# EasyEDA Pro project climbsnail-spotwelder-45c7d2f7.epro, schematic 大号控制板
Create Date: 2024-03-07; Page Name: P1; Project Name: SpotWelderDev; Schematic Name: 大号控制板; Update Date: 2024-11-25; Company: 嘉立创EDA; Page Size: A4; Version: V1.0
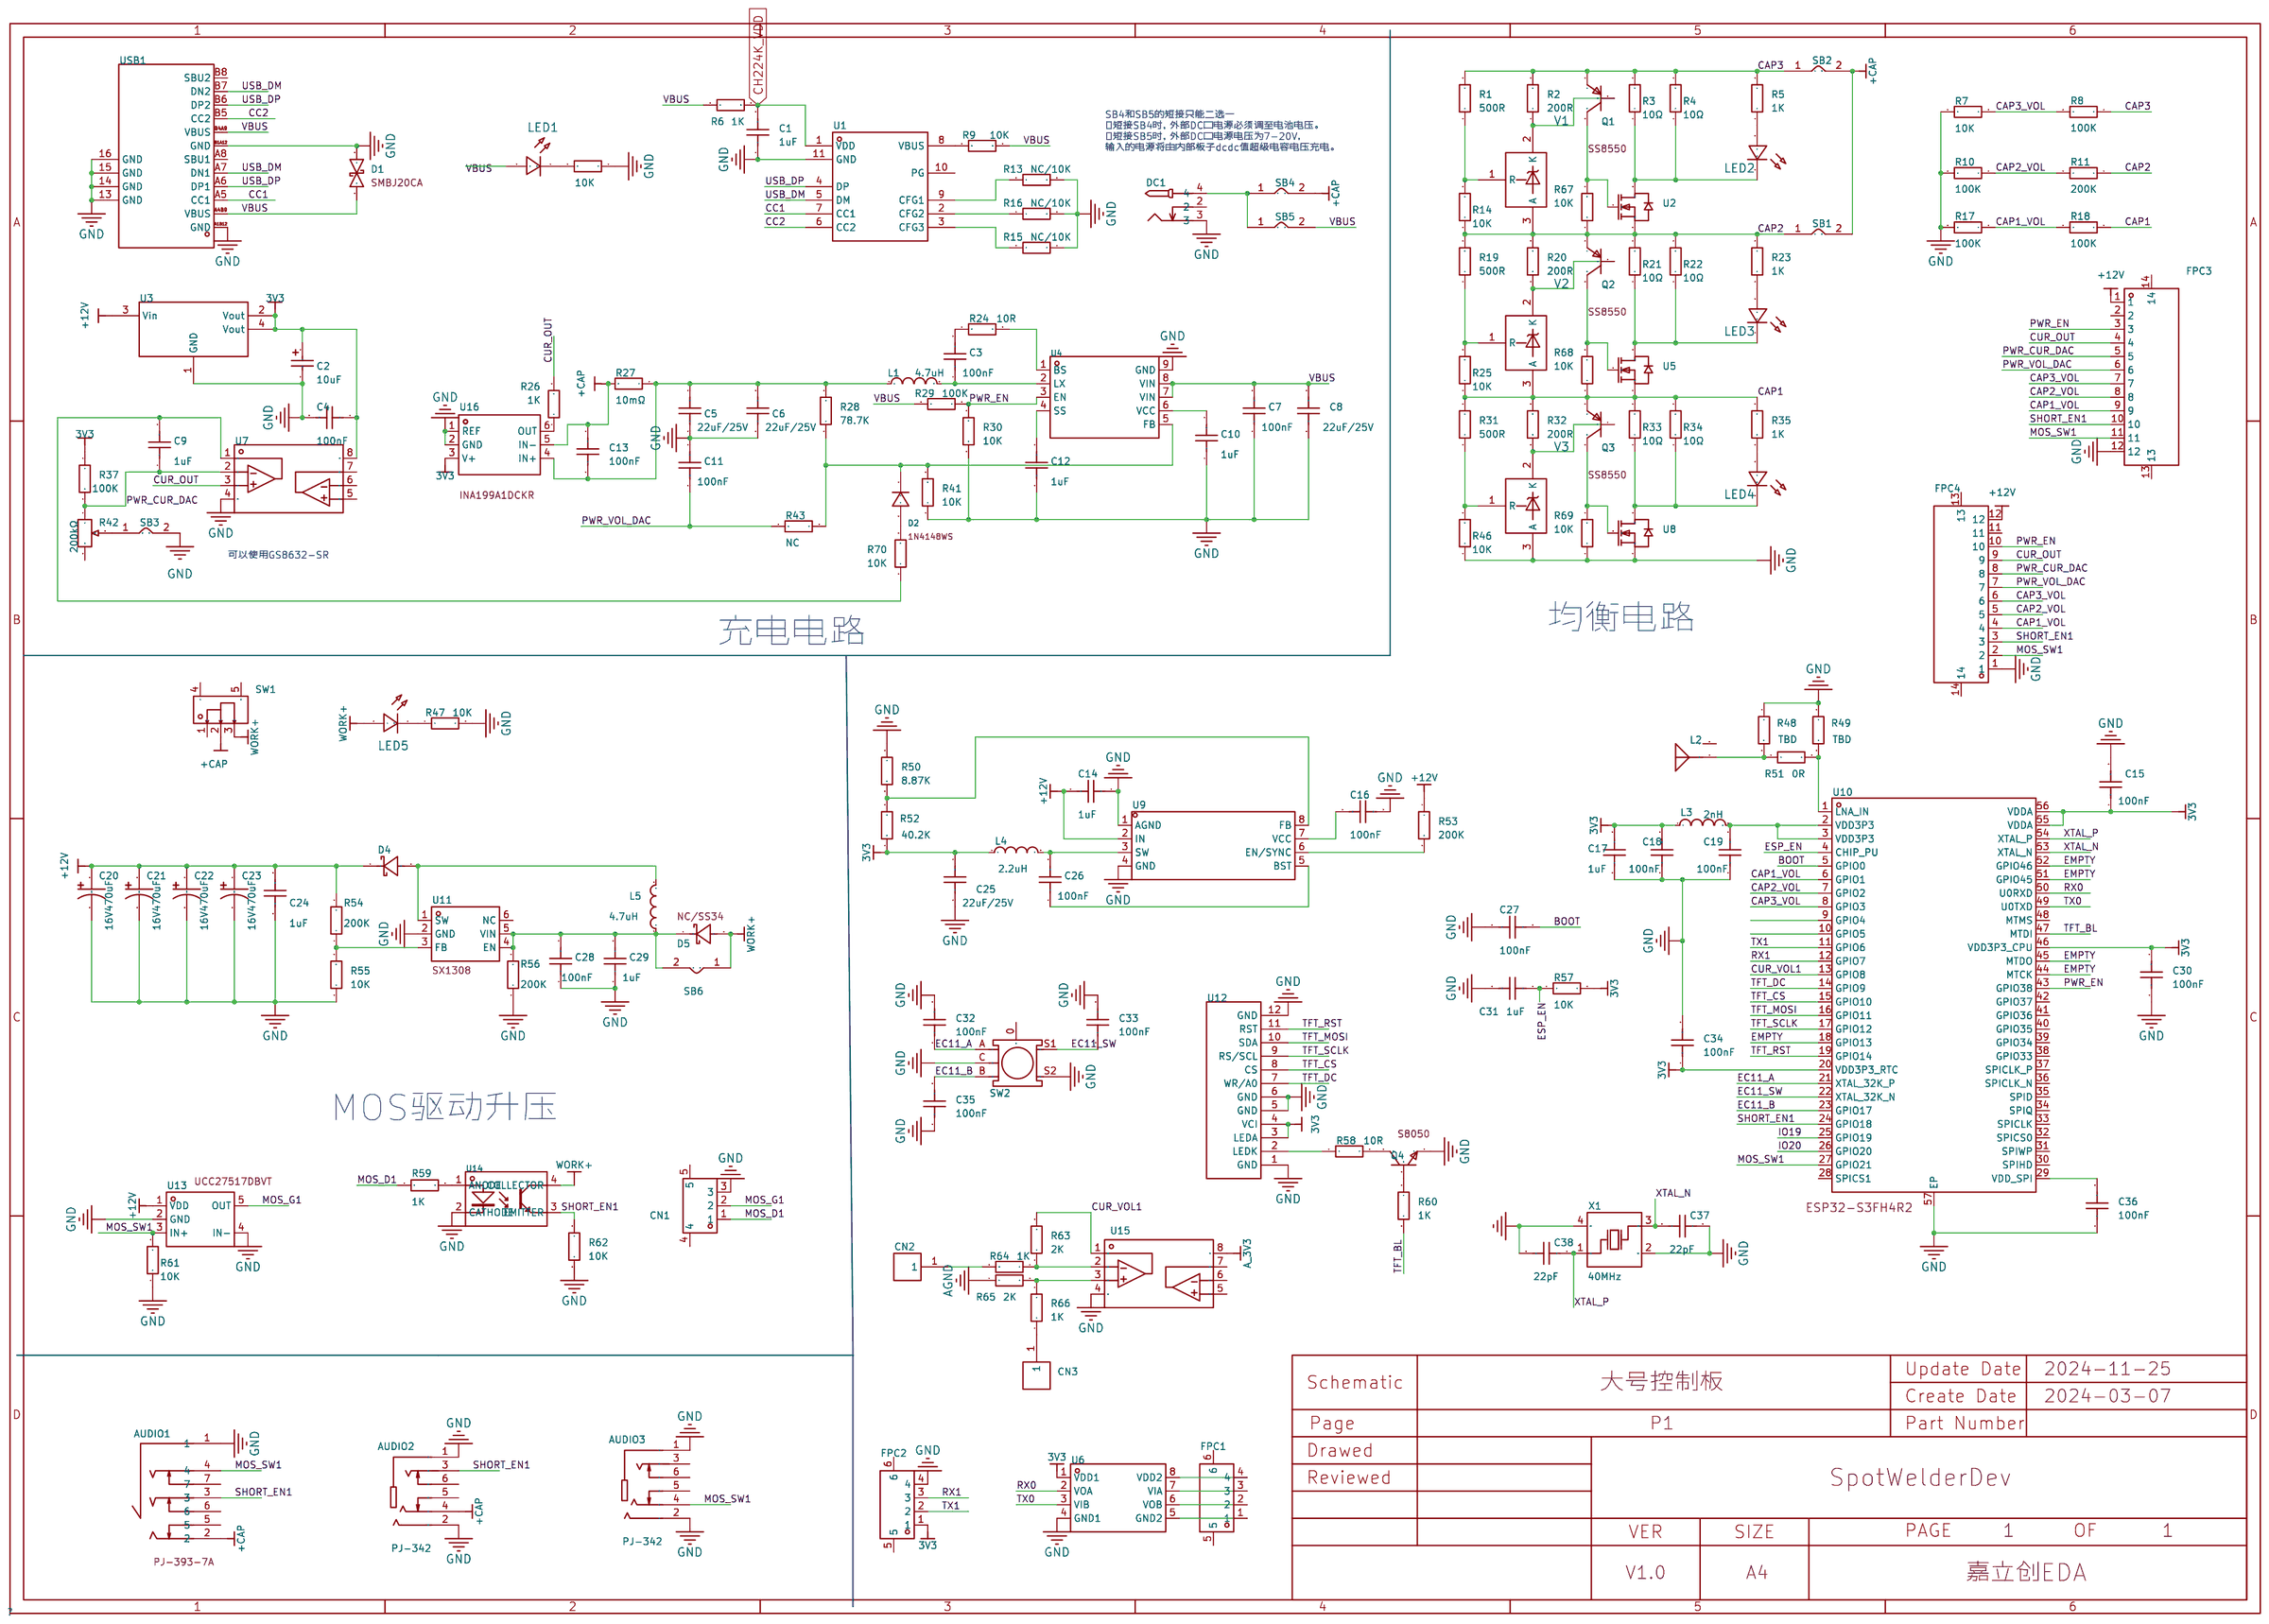
[diagram p3: schematic sheet]

## Parts
AUDIO1  PJ-393-7A  [AUDIO-SMD_PJ-393-7A]
AUDIO2  PJ-342  [AUDIO-SMD_PJ-3420-A-SMT_C319102]
AUDIO3  PJ-342  [AUDIO-SMD_PJ-3420-A-SMT_C319102]
C1  1uF  [C0603]
C2  10uF  [CAP-SMD-钽_3216]
C3  100nF  [C0402]
C4  100nF  [C0402]
C5  22uF/25V  [C1210]
C6  22uF/25V  [C1210]
C7  100nF  [C0402]
C8  22uF/25V  [C1210]
C9  1uF  [C0603]
C10  1uF  [C0603]
C11  100nF  [C0402]
C12  1uF  [C0603]
C13  100nF  [C0402]
C14  1uF  [C0603]
C15  100nF  [C0402]
C16  100nF  [C0402]
C17  1uF  [C0603]
C18  100nF  [C0402]
C19  100nF  [C0402]
C20  16V470uF  [CAP-TH_BD8.0-P3.50-D0.6-FD_1]
C21  16V470uF  [CAP-TH_BD8.0-P3.50-D0.6-FD_1]
C22  16V470uF  [CAP-TH_BD8.0-P3.50-D0.6-FD_1]
C23  16V470uF  [CAP-TH_BD8.0-P3.50-D0.6-FD_1]
C24  1uF  [C0603]
C25  22uF/25V  [C1210]
C26  100nF  [C0402]
C27  100nF  [C0402]
C28  100nF  [C0402]
C29  1uF  [C0603]
C30  100nF  [C0402]
C31  1uF  [C0603]
C32  100nF  [C0402]
C33  100nF  [C0402]
C34  100nF  [C0402]
C35  100nF  [C0402]
C36  100nF  [C0402]
C37  22pF  [C0603]
C38  22pF  [C0603]
CN1  XH2.54-3P  [CONN-SMD_3P-P2.50-WT]
CN2  5006  [TH_BD3.2-D2.0]
CN3  5006  [TH_BD3.2-D2.0]
D1  SMBJ20CA  [SMB_L4.6-W3.6-LS5.3-BI]
D2  1N4148WS  [SOD-323_L1.8-W1.3-LS2.5-RD]
D4  SS34  [SMA_L4.3-W2.6-LS5.2-RD]
D5  NC/SS34  [SMA_L4.3-W2.6-LS5.2-RD]
DC1  DC-005 2.0  [DC-IN-TH_DC-5520-1]
FPC1  X05A12H04G  [FPC-SMD_4P-P0.50_XKB_X05A12H04G]
FPC2  X05A12H04G  [FPC-SMD_4P-P0.50_XKB_X05A12H04G]
FPC3  XW05200-12  [FPC-SMD_12P-P0.50_XW05200-12]
FPC4  XW05200-12  [FPC-SMD_12P-P0.50_XW05200-12]
L1  4.7uH  [IND-SMD_L7.0-W6.6_MCW-0650-220]
L2  AN2051-245  [ANT2051]
L3  2nH  [L0402]
L4  2.2uH  [IND-SMD_L4.2-W4.2-C133189]
L5  4.7uH  [IND-SMD_L4.5-W4.0-1]
LED1  -  [LED_0603]
LED2  -  [LED_0603]
LED3  -  [LED_0603]
LED4  -  [LED_0603]
LED5  -  [LED_0603]
Q1  SS8550  [SOT-23-3_L2.9-W1.3-P1.90-LS2.4-BR]
Q2  SS8550  [SOT-23-3_L2.9-W1.3-P1.90-LS2.4-BR]
Q3  SS8550  [SOT-23-3_L2.9-W1.3-P1.90-LS2.4-BR]
Q4  S8050  [SOT-23-3_L2.9-W1.3-P1.90-LS2.4-BR]
R1  500R  [R0603]
R2  200R  [R0603]
R3  10Ω  [R2512]
R4  10Ω  [R2512]
R5  1K  [R0603]
R6  1K  [R1206]
R7  10K  [R0402]
R8  100K  [R0603]
R9  10K  [R0402]
R10  100K  [R0603]
R11  200K  [R0603]
R12  10K  [R0402]
R13  NC/10K  [R0402]
R14  10K  [R0402]
R15  NC/10K  [R0402]
R16  NC/10K  [R0402]
R17  100K  [R0603]
R18  100K  [R0603]
R19  500R  [R0603]
R20  200R  [R0603]
R21  10Ω  [R2512]
R22  10Ω  [R2512]
R23  1K  [R0603]
R24  10R  [R0603]
R25  10K  [R0402]
R26  1K  [R0603]
R27  10mΩ  [R2512]
R28  78.7K  [R0603]
R29  100K  [R0603]
R30  10K  [R0402]
R31  500R  [R0603]
R32  200R  [R0603]
R33  10Ω  [R2512]
R34  10Ω  [R2512]
R35  1K  [R0603]
R37  100K  [R0603]
R41  10K  [R0402]
R42  200kΩ  [RES-ADJ-TH_3P-L7.1-W6.9-P2.50-L_3362P]
R43  NC  [R0603]
R46  10K  [R0402]
R47  10K  [R0402]
R48  TBD  [R0402]
R49  TBD  [R0402]
R50  8.87K  [R0603]
R51  0R  [R0402]
R52  40.2K  [R0402]
R53  200K  [R0603]
R54  200K  [R0603]
R55  10K  [R0402]
R56  200K  [R0603]
R57  10K  [R0402]
R58  10R  [R0603]
R59  1K  [R0603]
R60  1K  [R0603]
R61  10K  [R0402]
R62  10K  [R0402]
R63  2K  [R0603]
R64  1K  [R0603]
R65  2K  [R0603]
R66  1K  [R0603]
R67  10K  [R0402]
R68  10K  [R0402]
R69  10K  [R0402]
R70  10K  [R0402]
SB1  短路点小型  [短路点]
SB2  短路点小型  [短路点]
SB3  短路点小型  [短路点]
SB4  短路点小型  [短路点]
SB5  短路点小型  [短路点]
SB6  短路点小型  [短路点]
SW1  SS-12D07-4  [SW-TH_3P-L8.6-W4.5-P2.60]
SW2  EC11S  [SW-TH_EC11S]
U1  -  [ESOP-10_L4.9-W3.9-P1.00-LS6.2-BL-EP]
U2  AO3400  [SOT-23-3_L2.9-W1.3-P1.90-LS2.4-BL-2]
U3  -  [SOT89L]
U4  SY8205FCC  [SOIC-8_L5.0-W4.0-P1.27-LS6.0-BL-EP2.0]
U5  AO3400  [SOT-23-3_L2.9-W1.3-P1.90-LS2.4-BL-2]
U6  π122U31  [SOIC-8_L4.9-W3.9-P1.27-LS6.0-BL]
U7  GS8632-SR / GS8332-SR  [SOP-8_L4.9-W3.9-P1.27-LS6.0-BL]
U8  AO3400  [SOT-23-3_L2.9-W1.3-P1.90-LS2.4-BL-2]
U9  -  [TSOT-23-8_L2.9-W1.6-P0.65-LS2.8-BR]
U10  ESP32-S3FH4R2  [QFN-56_L7.0-W7.0-P0.40-TL-EP4.0]
U11  SX1308  [SOT-23-6_L2.9-W1.6-P0.95-LS2.8-BR]
U12  -  [2.0TFT-FPC12P]
U13  UCC27517DBVT  [SOT-23-5_L2.9-W1.6-P0.95-LS2.8-BR]
U14  CT185GB(T1)  [SOP-4_L4.4-W3.6-P2.54-LS7.0-TL]
U15  GS8332-SR  [SOP-8_L4.9-W3.9-P1.27-LS6.0-BL]
U16  INA199A1DCKR  [SC-70-6_L2.2-W1.3-P0.65-LS2.1-BR]
USB1  TYPEC-304-BCP16  [USB-C-SMD_TYPEC-304-BCP16]
V1  -  [SOT-23-3_L2.9-W1.3-P1.90-LS2.4-BR]
V2  -  [SOT-23-3_L2.9-W1.3-P1.90-LS2.4-BR]
V3  -  [SOT-23-3_L2.9-W1.3-P1.90-LS2.4-BR]
X1  40MHz  [OSC-SMD_4P-L3.2-W2.5-BL_SIT8008BI]

## Library data of the parts
AUDIO1 = PJ-393-7A: 连接器类型:3.5mm耳机座;额定电流:500mA;额定电压:30V;; LCSC Part Name: 3.5mm耳机座; Supplier Part: C128990; Manufacturer: 韩国韩荣; Supplier Footprint: SMD; JLCPCB Part Class: Extended Part; Datasheet: https://atta.szlcsc.com/upload/public/pdf/source/20191225/C128990_2886EAE975D9B2375AA2BAB84A68AF9E.pdf; Supplier: LCSC; Connector Type: 3.5mm耳机座; Current Rating (Max): 500mA; Voltage Rating (Max): 30V
AUDIO2 AUDIO3 = PJ-3420-A-SMT: 连接器类型:3.5mm耳机座;额定电流:500mA;额定电压:30V;工作温度范围:-20℃~+70℃;焊接温度(最大值):235℃;; LCSC Part Name: 3.5mm耳机座; Supplier Part: C319102; Manufacturer: XKB Connectivity(中国星坤); Supplier Footprint: SMD; JLCPCB Part Class: 扩展库; Datasheet: https://atta.szlcsc.com/upload/public/pdf/source/20211015/FA11597DF53DC331FB6A72D64BA50234.pdf; Supplier: LCSC; Connector Type: 3.5mm耳机座; Current Rating (Max): 500mA; Voltage Rating (Max): 30V; Operating Temperature Range: -20℃~+70℃; Welding Temperature (Max): 235℃
C1 C9 C10 C12 C14 C17 C24 C29 C31 C37 C38 = CAP_0603: 容值:100nF;精度:±10%;额定电压:50V;温度系数:X7R;; Supplier Footprint: 0603
C2 = 钽电容_3216: 容值:10uF;精度:±10%;额定电压:16V;等效串联电阻:3Ω@100kHz;工作温度:-55℃~+125℃;; LCSC Part Name: 10uF ±10% 16V; Supplier Part: C7171; Manufacturer: Kyocera AVX; Manufacturer Part: TAJA106K016RNJ; Supplier Footprint: CASE-A-3216; JLCPCB Part Class: 基础库; Datasheet: https://atta.szlcsc.com/upload/public/pdf/source/20160107/1457707748093.pdf; Supplier: LCSC; Tolerance: ±10%; Rated Voltage: 16V; Equivalent Series Resistance(ESR): 3Ω@100kHz; Operating Temperature: -55℃~+125℃
C3 C4 C7 C11 C13 C15 C16 C18 C19 C26-C28 C30 C32-C36 = CAP_0402: Supplier Footprint: 0402
C5 C6 C8 C25 = CL32B226KOJNNNE: 容值:22uF;精度:±10%;额定电压:16V;材质(温度系数):X7R;; LCSC Part Name: 22uF ±10% 16V; Supplier Part: C55530; Manufacturer: SAMSUNG(三星); Supplier Footprint: 1210; JLCPCB Part Class: 扩展库; Datasheet: https://atta.szlcsc.com/upload/public/pdf/source/20191106/C444885_D1DE823F0ED498E02883F0194C396E9C.pdf; Supplier: LCSC; Tolerance: ±10%; Voltage Rated: 16V; Temperature Coefficient: X7R
C20-C23 = SM4771AME072RB: 容值:470uF;精度:±20%;额定电压:10V;纹波电流:-;等效串联电阻:-;; LCSC Part Name: 470uF ±20% 10V; Supplier Part: C399139; Manufacturer: Xunda(讯达); Supplier Footprint: 插件,D8xL7mm; JLCPCB Part Class: 扩展库; Datasheet: https://atta.szlcsc.com/upload/public/pdf/source/20190625/C399172_C16A14E74FCFCF01C711FA10034874FD.pdf; Supplier: LCSC; Tolerance: ±20%; Rated Voltage: 10V; φD: 8mm; L: 7mm; Lead Spacing: 3.5mm; Lifetime @ Temp: 1000hrs@105℃
CN1 = XH2.54-3P: Supplier Part: C9900004346; Supplier Footprint: XH2.54-3PSMD; JLCPCB Part Class: 扩展库; Supplier: LCSC
CN2 CN3 = 5006_C2906764: 测试点; Supplier Part: C2906764; Manufacturer: Keystone; JLCPCB Part Class: 扩展库; Datasheet: https://atta.szlcsc.com/upload/public/pdf/source/20211115/64B944F8418AA2CF0680BB1B201435FB.pdf; Supplier: LCSC
D1 = SMBJ20CA_C330066: 极性:Bidirectional;峰值脉冲电流（10/1000us）:18.6A;箝位电压:32.4V;击穿电压（最小值）:22.2V;反向关断电压（典型值）:20V;; Supplier Part: C330066; Manufacturer: JJW(捷捷微); Supplier Footprint: SMB; JLCPCB Part Class: 扩展库; Datasheet: https://atta.szlcsc.com/upload/public/pdf/source/20181120/C330066_68D95E2092C63B883987103083FFA20D.pdf; Supplier: LCSC
D2 = 1N4148WS_C2128: 二极管配置:独立式;功率:200mW;直流反向耐压(Vr):100V;平均整流电流(Io):150mA;正向压降(Vf):1.25V@150mA;反向电流(Ir):1uA@75V;反向恢复时间(trr):4ns;工作温度:+150℃@(Tj);; LCSC Part Name: 100V 150mA 4ns T4; Supplier Part: C2128; Manufacturer: CJ(江苏长电/长晶); Supplier Footprint: SOD-323; JLCPCB Part Class: 基础库; Datasheet: https://atta.szlcsc.com/upload/public/pdf/source/20140809/1457707208178.pdf; Supplier: LCSC; Diode Configuration: 独立式; Power Dissipation: 200mW; Reverse Voltage (Vr): 100V; Average Rectified Current (Io): 150mA; Forward Voltage (Vf@If): 1.25V@150mA; Reverse Leakage Current: 1uA@75V; Reverse Recovery Time (trr): 4ns; Operating Temperature: +150℃@(Tj)
D4 = SS34_C3032484: Supplier Part: C3032484; Manufacturer: TDD(台冠电子); Supplier Footprint: SMA; JLCPCB Part Class: Extended Part; Datasheet: https://atta.szlcsc.com/upload/public/pdf/source/20220622/9D70D0693761B542BF6F533590093AA5.pdf; Supplier: LCSC
D5 = SS34_C3032484: LCSC Part Name: SS34; Supplier Part: C3032484; Manufacturer: TDD(台冠电子); Supplier Footprint: SMA; JLCPCB Part Class: Extended Part; Datasheet: https://atta.szlcsc.com/upload/public/pdf/source/20220622/9D70D0693761B542BF6F533590093AA5.pdf; Supplier: LCSC
DC1 = DC-005 2.0: 连接器类型:DC电源插座;安装方式:弯插;触点内径:2mm;触点外径:6.4mm;额定电流:-;额定电压:-;工作温度范围:-;; LCSC Part Name: DC电源插座 内径:2mm 外径:6.4mm 铁材质; Supplier Part: C16214; Manufacturer: BOOMELE(博穆精密); Supplier Footprint: 插件; JLCPCB Part Class: 扩展库; Datasheet: https://atta.szlcsc.com/upload/public/pdf/source/20190827/C16214_DA59F99E888FED58D9833F5341D610B0.pdf; Supplier: LCSC; Connector Type: DC电源插座; Mounting Style: 弯插; Inside Contact Diameter: 2mm; Outside Contact Diameter: 6.4mm
FPC1 FPC2 = X05A12H04G: 间距:0.5mm;触点数量:4;锁定特性:翻盖式;安装类型:卧贴;触点类型:双侧触点/上下接;工作温度范围:-40℃~+85℃;焊接温度(最大值):260℃;; LCSC Part Name: 0.5mm P数:4 翻盖式 双侧触点/上下接; Supplier Part: C2880761; Manufacturer: XKB Connectivity(中国星坤); Supplier Footprint: SMD,P=0.5mm; Datasheet: https://atta.szlcsc.com/upload/public/pdf/source/20211011/7594ED4A8B21B39D6C2C07571E80F84E.pdf; Supplier: LCSC; Pitch: 0.5mm; Number of Contacts: 4; Locking Feature: 翻盖式; Mounting Type: 卧贴; Contact Type: 双侧触点/上下接; Height Above Board: 1.2mm; FFC, FCB Thickness: 0.3mm; Contact Material: 磷青铜; Contact Plating: 金; Operating Temperature Range: -40℃~+85℃; Welding Temperature (Max): 260℃
FPC3 FPC4 = XW05200-12: 锁定特性:翻盖式;触点类型:下接;触点数量:12P;间距:0.5mm;安装类型:卧贴;; LCSC Part Name: 间距:0.5mm P数:12P 翻盖式 下接; Supplier Part: C376060; Manufacturer: MINTRON(明硕); Supplier Footprint: SMD,P=0.5mm,卧贴; JLCPCB Part Class: 扩展库; Datasheet: https://atta.szlcsc.com/upload/public/pdf/source/20190925/C432224_CE7A48F01954EF0C4D4C1EC1B5A1C250.pdf; Supplier: LCSC; Locking Feature: 翻盖式; Contact Type: 下接; Number of Contacts: 12P; Pitch: 0.5mm; Mounting Type: 卧贴; FFC, FCB Thickness: 0.3mm; Height Above Board: 2mm
L1 = MCW-0650-220-N2: 电感值:22uH;精度:±20%;额定电流:2.6A;直流电阻(DCR):140mΩ;; LCSC Part Name: 22uH ±20% 2.6A 140mΩ; Supplier Part: C177257; Manufacturer: Hk-hotline(合泰盟方); Supplier Footprint: SMD,6.95x6.6x5mm; JLCPCB Part Class: 扩展库; Datasheet: https://atta.szlcsc.com/upload/public/pdf/source/20180126/C177257_15169518534351308687.pdf; Supplier: LCSC; Tolerance: ±20%; Rated Current: 2.6A; DC Resistance (DCR): 140mΩ
L2 = AN2051-245: 小体积，高增益，WIFI，蓝牙，zigBee 2.4G天线; Supplier Part: C99727; Manufacturer: rainsun(霖昱微); Supplier Footprint: 2051; JLCPCB Part Class: 扩展库; Datasheet: https://atta.szlcsc.com/upload/public/pdf/source/20170329/1490752053541.pdf; Supplier: LCSC
L3 = LQG15HS2N0S02D: 电感值:2nH;精度:±0.3nH;额定电流:900mA;饱和电流(Isat):-;直流电阻(DCR):90mΩ;; LCSC Part Name: 2nH ±0.3nH 90mΩ; Supplier Part: C18216; Manufacturer: muRata(村田); Supplier Footprint: 0402; JLCPCB Part Class: 扩展库; Datasheet: https://atta.szlcsc.com/upload/public/pdf/source/20190514/C18216_4C6D770518CF7A3B206943E09D2940CE.pdf; Supplier: LCSC; Tolerance: ±0.3nH; Rated Current: 900mA; DC Resistance (DCR): 90mΩ; Q @ Freq: 8@100MHz; Frequency - Self Resonant: 6GHz
L4 = HA42-2R2MT: 电感值:2.2uH;精度:±20%;额定电流:3A;饱和电流(Isat):5A;直流电阻(DCR):58mΩ;; LCSC Part Name: 2.2uH ±20% 3A 58mΩ; Supplier Part: C2936650; Manufacturer: FH(风华); Supplier Footprint: 0420; JLCPCB Part Class: 扩展库; Datasheet: https://atta.szlcsc.com/upload/public/pdf/source/20211228/DF5AAD1C624D1DACD739A51BD94418BC.pdf; Supplier: LCSC; Tolerance: ±20%; Rated Current: 3A; Saturation Current (Isat): 5A; DC Resistance (DCR): 58mΩ
L5 = MCS0420-4R7MPN2: 电感值:4.7uH;精度:±20%;额定电流:2.2A;饱和电流(Isat):3.5A;直流电阻(DCR):98mΩ;; LCSC Part Name: 4.7uH ±20% 2.2A 98mΩ; Supplier Part: C2937092; Manufacturer: PSA(信昌电陶); Supplier Footprint: 0420; JLCPCB Part Class: Extended Part; Datasheet: https://atta.szlcsc.com/upload/public/pdf/source/20220121/BD01ABADD177E465ADC6F87339B1CE90.pdf; Supplier: LCSC; Tolerance: ±20%; Rated Current: 2.2A; Saturation Current (Isat): 3.5A; DC Resistance (DCR): 98mΩ
LED1-LED5 = LED_0603-R: Supplier Footprint: 0603
Q1-Q3 = SS8550 Y2_C8542: 晶体管类型:PNP;集射极击穿电压(Vceo):25V;集电极电流(Ic):1.5A;功率(Pd):300mW;集电极截止电流(Icbo):100nA;集电极-发射极饱和电压(VCE(sat)@Ic,Ib):500mV@800mA,80mA;直流电流增益(hFE@Ic,Vce):200@100mA,1V;特征频率(fT):100MHz;工作温度:+150℃@(Tj);; LCSC Part Name: PNP 25V 1.5A; Supplier Part: C8542; Manufacturer: CJ(江苏长电/长晶); Supplier Footprint: SOT-23; JLCPCB Part Class: 基础库; Datasheet: https://atta.szlcsc.com/upload/public/pdf/source/20140809/1457707214734.pdf; Supplier: LCSC; Transistor Type: PNP; Collector-Emitter Breakdown Voltage (Vceo): 25V; Collector Current (Ic): 1.5A; Power Dissipation (Pd): 300mW; Collector Cut-Off Current (Icbo): 100nA; Collector-Emitter Saturation Voltage (VCE(sat)@Ic,Ib): 500mV@800mA,80mA; DC Current Gain (hFE@Ic,Vce): 200@100mA,1V; Transition Frequency (fT): 100MHz; Operating Temperature: +150℃@(Tj)
Q4 = S8050_C2891804: Supplier Part: C2891804; Manufacturer: YONGYUTAI(永裕泰); Supplier Footprint: SOT-23; JLCPCB Part Class: 扩展库; Datasheet: https://atta.szlcsc.com/upload/public/pdf/source/20210901/5347316A10609C628D4D69AE01446E5B.pdf; Supplier: LCSC
R1 R2 R5 R8 R10 R11 R17-R20 R23 R24 R26 R28 R29 R31 R32 R35 R37 R43 R50 R53 R54 R56 R58-R60 R63-R66 = Res_0603: Supplier Footprint: 0603
R3 R4 R21 R22 R33 R34 = RC-12L3R3JT: 阻值:3.3Ω;精度:±5%;功率:1W;; LCSC Part Name: 3.3Ω ±5% 1W; Supplier Part: C341653; Manufacturer: FH(风华); Supplier Footprint: 2512; JLCPCB Part Class: 扩展库; Datasheet: https://atta.szlcsc.com/upload/public/pdf/source/20181129/C341653_9079355966F8762BA30788198634DD3F.pdf; Supplier: LCSC; Tolerance: ±5%; Power(Watts): 1W; Temperature Coefficient: ±250ppm/℃
R6 = Res_1206: Supplier Footprint: 1206
R7 R9 R12-R16 R25 R30 R41 R46-R49 R51 R52 R55 R57 R61 R62 R67-R70 = Res_0402: Supplier Footprint: 0402
R27 = FMF25FPJR010-LH_C105366: 阻值:10mΩ;精度:±1%;功率:2W;; Power(Watts): 2W; Supplier: LCSC; Supplier Part: C105366; Supplier Footprint: 2512; JLCPCB Part Class: 扩展库; LCSC Part Name: 10mΩ ±1% 2W; Tolerance: ±1%; Datasheet: https://atta.szlcsc.com/upload/public/pdf/source/20170410/1491788445504.pdf; Manufacturer: PSA(信昌电陶); Manufacturer Part: FMF25FPJR010-LH; Temperature Coefficient: ±70ppm/℃
R42 = 3362P-1-204: 阻值:200kΩ;精度:±10%;; LCSC Part Name: 200kΩ ±10%; Supplier Part: C118941; Manufacturer: BOCHEN(博晨); Supplier Footprint: 插件; JLCPCB Part Class: Extended Part; Datasheet: https://atta.szlcsc.com/upload/public/pdf/source/20171114/C118941_15106326619261117430.pdf; Supplier: LCSC; Tolerance: ±10%
SB1-SB6 = 短路点小型
SW1 = SS-12D07-4: 安装方式:直插;机械寿命:10000;滑钮形状:矩形柱状;引脚样式:PC引脚;工作温度:-10~+60;开关长度:8.6mm;开关宽度:4.5mm;开关高度:8.7mm;; Supplier Part: C2857672; Manufacturer: ROCPU Switches(台普); Supplier Footprint: 插件; JLCPCB Part Class: Extended Part; Datasheet: https://atta.szlcsc.com/upload/public/pdf/source/20211210/33917120591D6789761CF4E765778736.pdf; Supplier: LCSC; Mounting Style: 直插; Mechanical Life: 10000; Actuator Style: 矩形柱状; Pin Style: PC引脚; Operating Temperature: -10~+60; Switch Length: 8.6mm; Switch Width: 4.5mm; Switch Height: 8.7mm
SW2 = EC11S: Supplier Part: C2895684; Supplier Footprint: Though hole; JLCPCB Part Class: 扩展库; Datasheet: 2021-09-09/817225A/75f6073b840d48199edf7d0159dcd6be/EC11S-H6-5B2-20K10-20P.pdf; Supplier: LCSC
U1 = CH224K: 类型:-;协议类别:-;驱动器/接收器数:-;数据速率:-;; Supplier Part: C970725; Manufacturer: WCH(南京沁恒); Supplier Footprint: ESSOP-10; JLCPCB Part Class: Extended Part; Datasheet: https://atta.szlcsc.com/upload/public/pdf/source/20220425/5F3B4646B9AC793D88468BCB08421765.pdf; Supplier: LCSC
U2 U5 U8 = AO3400: Supplier Part: C9900013365; Supplier Footprint: SOT-23; JLCPCB Part Class: 扩展库; Datasheet: 2022-04-08/830516A/bc9ad5c09bcf47d2b260b07161827fa1/AO3400A.PDF; Supplier: LCSC
U3 = CJ1117-XXX-SOT89L: 锡膏贴片
U4 = SY8205FCC: 功能类型:降压型;同步整流:-;输出通道数:-;拓扑结构:-;输入电压:-;输出电流(最大值):-;开关频率:-;; LCSC Part Name: 降压型; Supplier Part: C111875; Manufacturer: silergy(矽力杰); Supplier Footprint: SOIC-8-EP; JLCPCB Part Class: 扩展库; Datasheet: https://atta.szlcsc.com/upload/public/pdf/source/20180224/C111875_15194360670851363275.pdf; Supplier: LCSC; Function: 降压型
U6 = π122U31: 应用:-;隔离技术:-;通道数:2;隔离电压(Viso):3000Vrms;; LCSC Part Name: 增强型ESD,3.0kVrms/6.0kVrms 150Kbps双通道数字隔离器; Supplier Part: C471590; Manufacturer: 2Pai Semi(荣湃); Supplier Footprint: SOIC-8; JLCPCB Part Class: 扩展库; Datasheet: https://atta.szlcsc.com/upload/public/pdf/source/20191223/C471590_0EC0A3D8C50EA147F11BC2F4781C203C.pdf; Supplier: LCSC; Number of Channels: 2; Forward Channel: 0; Reverse channel: 2; Voltage Isolation or Not: 带电压隔离; Isolation voltage: 3000Vrms; Data Rate: 150Kbps; Supply Voltage: 3V~5.5V
U7 U15 = GS8332-SR: 运放类型:Zero-Drift;放大器组数:2;增益带宽积（GBP）:350KHz;压摆率（SR）:0.2 V/us;电源电压:2.1V ~ 5.5V;各通道供电电流:20uA;; LCSC Part Name: GS8332 SOP-8; Supplier Part: C157713; Manufacturer: Gainsil(聚洵); Supplier Footprint: SOP-8-150mil; JLCPCB Part Class: 扩展库; Datasheet: https://atta.szlcsc.com/upload/public/pdf/source/20200615/C605419_D70E1851DA800D34ADA08E397521FED7.pdf; Supplier: LCSC; Amplifier Type: Zero-Drift; Number of Circuits: 2; Gain Bandwidth Product（GBP）: 350KHz; Slew Rate（SR）: 0.2 V/us; Output Type: Rail-to-Rail; Supply Voltage（Single）: 2.1V ~ 5.5V; Iq per channel (Typ): 20uA; Operating Temperature: -40°C ~ 125°C
U9 = MP2225GJ-Z: 最大输入电压:-;可输出电流:-;; Supplier Part: C133066; Supplier Footprint: TSOT-23-8; JLCPCB Part Class: 扩展库; Supplier: LCSC
U10 = ESP32-S3: Supplier Part: C2913192; Manufacturer: ESPRESSIF(乐鑫); Supplier Footprint: QFN-56-EP(7x7); JLCPCB Part Class: 扩展库; Datasheet: https://atta.szlcsc.com/upload/public/pdf/source/20220211/8CA5C1C53CA8E3D1871752073201D38A.pdf; Supplier: LCSC
U11 = SX1308: 功能类型:升压型;同步整流:否;输出通道数:1;拓扑结构:升压式;输入电压:2V~24V;输出电压:28V;输出电流(最大值):-;开关频率:1.2MHz;; LCSC Part Name: 升压型 Vin=2V~24V Vout=28V; Supplier Part: C78162; Manufacturer: SX(硕芯科技); Supplier Footprint: SOT-23-6; JLCPCB Part Class: Extended Part; Datasheet: https://atta.szlcsc.com/upload/public/pdf/source/20160920/1474356679185.pdf; Supplier: LCSC; Function: 升压型; Synchronous Rectification: 否; Number of Outputs: 1; Topology: 升压式; Input Voltage: 2V~24V; Output Voltage: 28V; Switching Frequency: 1.2MHz
U12 = 2.0TFT-FPC12P-ST7789
U13 = UCC27517DBVT: 采用 SOT-23 封装、具有 5V UVLO 和 13ns 传播延迟的 4A/4A 单通道栅极驱动器 5-SOT-23 -40 to 140; Supplier Part: C2877770; Manufacturer: TI(德州仪器); Supplier Footprint: SOT-23-5; JLCPCB Part Class: Extended Part; Supplier: LCSC
U14 = CT185GB(T1): 输入电压类型:DC;输出通道数:1;正向电压:1.24V;反向电压:6V;输出电流:50mA;接收端电压:80V;集射极饱和电压(Vce(sat)@Ic,IF):300mV@2.4mA,8mA;隔离电压(rms):3.75kV;; LCSC Part Name: DC输入 隔离电压(rms):3750V; Supplier Part: C191836; Manufacturer: CT MICRO; Supplier Footprint: SOP-4-2.54mm; JLCPCB Part Class: Extended Part; Datasheet: https://atta.szlcsc.com/upload/public/pdf/source/20180504/C191836_4B58AF92622DBE42072B31496F4BAFB3.pdf; Supplier: LCSC; Input voltage type: DC; Output Type: 光电三极管; Number of Outputs: 1; Forward Voltage: 1.24V; Reverse Voltage: 6V; Output Current: 50mA; Receiving End Voltage: 80V; Collector-Emitter Saturation Voltage (Vce(sat)@Ic,IF): 300mV@2.4mA,8mA; Rise time: 5us@2mA,100Ω; Fall time: 9us@2mA,100Ω; Isolation Voltage(rms): 3.75kV; Operating Temperature: -55℃~+110℃
U16 = INA199A1DCKR: INA199 26V、双向、零漂移、低侧/高侧、电压输出分流监控器; Supplier Part: C59135; Manufacturer: TI(德州仪器); Supplier Footprint: SOT-363(SC-70-6); JLCPCB Part Class: 扩展库; Datasheet: https://www.ti.com/cn/lit/gpn/ina199; Supplier: LCSC; Supply Voltage: -300mV~26V; Supply Current: 300uA; Operating Temperature: -40℃~+125℃
USB1 = TYPEC-304-BCP16_C720629: 连接器类型:Type-C;标准:USB 3.1;公母:母座;触点数量:16;端口数量:1;安装方式:卧贴;额定电流 - 电源:3A;工作温度范围:-25~+85;焊接温度(最大值):260;; LCSC Part Name: Type-C 母座 卧贴 停产 停产; Supplier Part: C720629; Manufacturer: XUNPU(讯普); Supplier Footprint: SMD; JLCPCB Part Class: Extended Part; Datasheet: https://atta.szlcsc.com/upload/public/pdf/source/20220210/1FE0FEFF7D6A20C111212527D3DED014.pdf; Supplier: LCSC; Connector Type: Type-C; Standard: USB 3.1; Gender: 母座; Number of Contacts: 16; Number of Ports: 1; Mounting Style: 卧贴; Current Rating - Power (Max): 3A; Operating Temperature Range: -25~+85; Welding Temperature (Max): 260
V1-V3 = CJ431: 输出电压（最小值/固定）:2.5V;温度系数:50ppm/°C;精度:±0.5%;; LCSC Part Name: CJ431 0.5%; Supplier Part: C3113; Manufacturer: CJ（江苏长电/长晶）; LCSC On Sale: 1; Supplier Footprint: SOT-23(SOT-23-3); Price: 0.298; JLCPCB Part Class: 基础库; JLCPCB On Sale: 1; Datasheet: https://atta.szlcsc.com/upload/public/pdf/source/20180115/C3113_15160149461261269385.pdf; Supplier: LCSC; Voltage - Output (Min/Fixed): 2.5V; Output Current: 100mA; Voltage - Output (Max): 36V; Output Type: 可调式; Operating Temperature: -25°C ~ 85°C(TA); Temperature Coefficient: 50ppm/°C; Cathode Current: 1mA; Tolerance: ±0.5%; Reference Type: 分流器
X1 = X322540MPB4SI: 晶振类型:贴片无源晶振;频率:40MHz;频率公差:±10ppm;频率稳定度:±30ppm;负载电容:15pF;工作温度:-40℃~+85℃;; LCSC Part Name: 40MHz ±10ppm 15pF; Supplier Part: C9010; Manufacturer: YXC扬兴科技; Supplier Footprint: SMD3225-4P; JLCPCB Part Class: 扩展库; Datasheet: https://atta.szlcsc.com/upload/public/pdf/source/20210329/C112971_1F611BDC486E193C1706F6D8EB5AA189.pdf; Supplier: LCSC; Crystal Type: 贴片无源晶振; Frequency Tolerance: ±10ppm; Frequency Stability: ±30ppm; Load Capacitance: 15pF; Operating Temperature: -40℃~+85℃

## Nets
3V3: C2.1 C4.1 C15.1 C17.2 C18.2 C25.1 C30.2 C34.1 FPC2.1 L3.1 L4.1 R37.1 R52.1 R57.2 U3.2(Vout) U3.4(Vout) U6.1(VDD1) U7.8(VDD) U10.20(VDD3P3_RTC) U10.46(VDD3P3_CPU) U10.55(VDDA) U10.56(VDDA) U12.3(LEDA) U12.4(VCI) U16.3(V+)
+12V: C14.2 C20.1 C21.1 C22.1 C23.1 C24.2 D4.1(K) FPC3.1 FPC4.12 R53.1 R54.2 U3.3(Vin) U9.2(IN) U13.1(VDD)
AGND: R65.1
GND: AUDIO1.1 AUDIO2.1 AUDIO2.2 AUDIO3.1 AUDIO3.2 C1.1 C2.2 C4.2 C5.2 C6.2 C7.1 C8.2 C10.1 C11.2 C12.1 C14.1 C15.2 C16.2 C17.1 C18.1 C19.1 C20.2 C21.2 C22.2 C23.2 C24.1 C25.2 C27.1 C28.1 C29.1 C30.1 C31.2 C32.2 C33.2 C34.2 C35.1 C36.1 C37.1 C38.2 CN1.3 D1.2(A) DC1.3 FPC2.4 FPC3.12 FPC4.1 Q4.2(E) R7.1 R10.2 R12.1 R13.2 R15.1 R16.2 R17.2 R30.1 R41.1 R46.1 R47.2 R48.1 R49.1 R50.1 R55.1 R56.1 R61.1 R62.1 R69.1 SB3.2 SW2.C SW2.S2 U1.11(GND) U3.1(GND) U4.9(GND) U6.4(GND1) U7.4(VSS) U8.2(S) U9.1(AGND) U9.4(GND) U10.57(EP) U11.2(GND) U12.1(GND) U12.5(GND) U12.6(GND) U12.12(GND) U13.2(GND) U13.4(IN-) U14.2(CATHODE) U15.4(VSS) U16.1(REF) U16.2(GND) USB1.13(GND) USB1.14(GND) USB1.15(GND) USB1.16(GND) USB1.A1B12(GND) USB1.B1A12(GND) V3.3(A) X1.2(GND) X1.4(GND)
VBUS: C7.2 C8.1 D1.1(K) LED1.2(A) R6.1 R9.2 R29.1 SB5.2 U4.7(VIN) U4.8(VIN) USB1.A4B9(VBUS) USB1.B4A9(VBUS)
+CAP: AUDIO1.2 AUDIO2.4 C13.1 R27.2 SB1.2 SB2.2 SB4.2 SW1.2 U16.5(IN-)
A_3V3: U15.8(VDD)
BOOT: C27.2 U10.5(GPIO0)
CAP1: Q3.2(E) R18.1 R25.1 R31.2 R32.2 R33.2 R34.2 R35.2 R68.1 U5.2(S) V2.3(A)
CAP1_VOL: FPC3.9 FPC4.4 R17.1 R18.2 U10.6(GPIO1)
CAP2: Q2.2(E) R11.1 R14.1 R19.2 R20.2 R21.2 R22.2 R23.2 R67.1 SB1.1 U2.2(S) V1.3(A)
CAP2_VOL: FPC3.8 FPC4.5 R10.1 R11.2 U10.7(GPIO2)
CAP3: Q1.2(E) R1.2 R2.2 R3.2 R4.2 R5.2 R8.1 SB2.1
CAP3_VOL: FPC3.7 FPC4.6 R7.2 R8.2 U10.8(GPIO3)
CC1: U1.7(CC1) USB1.A5(CC1)
CC2: U1.6(CC2) USB1.B5(CC2)
CH224K_VDD: C1.2 R6.2 U1.1(VDD)
CUR_OUT: FPC3.4 FPC4.9 R26.2 U7.3(INA+)
CUR_VOL1: R63.2 U10.13(GPIO8) U15.1(OUTA)
EC11_A: C32.1 SW2.A U10.21(XTAL_32K_P)
EC11_B: C35.2 SW2.B U10.23(GPIO17)
EC11_SW: C33.1 SW2.S1 U10.22(XTAL_32K_N)
EMPTY: U10.18(GPIO13) U10.44(MTCK) U10.45(MTDO) U10.51(GPIO45) U10.52(GPIO46)
ESP_EN: C31.1 R57.1 U10.4(CHIP_PU)
IO19: U10.25(GPIO19)
IO20: U10.26(GPIO20)
MOS_D1: CN1.1 R59.1
MOS_G1: CN1.2 U13.5(OUT)
MOS_SW1: AUDIO1.4 AUDIO3.4 FPC3.11 FPC4.2 R61.2 U10.27(GPIO21) U13.3(IN+)
PWR_CUR_DAC: C9.1 FPC3.5 FPC4.8 R37.2 R42.1 U7.2(INA-)
PWR_EN: FPC3.3 FPC4.10 R29.2 R30.2 U4.3(EN) U10.43(GPIO38)
PWR_VOL_DAC: C11.1 FPC3.6 FPC4.7 R43.1
RX0: U6.2(VOA) U10.50(U0RXD)
RX1: FPC2.3 U10.12(GPIO7)
SHORT_EN1: AUDIO1.3 AUDIO2.3 FPC3.10 FPC4.3 R62.2 U10.24(GPIO18) U14.3(EMITTER)
TFT_BL: R60.2 U10.47(MTDI)
TFT_CS: U10.15(GPIO10) U12.8(CS)
TFT_DC: U10.14(GPIO9) U12.7(WR/A0)
TFT_MOSI: U10.16(GPIO11) U12.10(SDA)
TFT_RST: U10.19(GPIO14) U12.11(RST)
TFT_SCLK: U10.17(GPIO12) U12.9(RS/SCL)
TX0: U6.3(VIB) U10.49(U0TXD)
TX1: FPC2.2 U10.11(GPIO6)
USB_DM: U1.5(DM) USB1.A7(DN1) USB1.B7(DN2)
USB_DP: U1.4(DP) USB1.A6(DP1) USB1.B6(DP2)
WORK+: D5.2(A) LED5.2(A) SB6.1 SW1.3 U14.4(COLLECTOR)
XTAL_N: C37.2 U10.53(XTAL_N) X1.3(OSC2)
XTAL_P: C38.1 U10.54(XTAL_P) X1.1(OSC1)
$1N2186: R54.1 R55.2 U11.3(FB)
$1N2189: D4.2(A) L5.2 U11.1(SW)
$1N2220: R16.1 U1.2(CFG2)
$1N2250: R24.2 U4.1(BS)
$1N2253: C3.1 L1.2 U4.2(LX)
$1N2275: C10.2 U4.6(VCC)
$1N2339: C12.2 U4.4(SS)
$1N5082: C36.2 U10.29(VDD_SPI)
$1N5084: C19.2 L3.2 U10.2(VDD3P3) U10.3(VDD3P3)
$1N5085: R49.2 R51.2 U10.1(LNA_IN)
$1N5087: L2.1(ANT) R48.2 R51.1
$1N5700: R50.2 R52.2 U9.8(FB)
$1N5701: C16.1 U9.7(VCC)
$1N5704: R53.2 U9.6(EN/SYNC)
$1N5705: C26.1 U9.5(BST)
$1N5706: C26.2 L4.2 U9.3(SW)
$1N10781: R63.1 R64.1 U15.2(INA-)
$1N10782: R65.2 R66.2 U15.3(INA+)
$1N10785: CN2.1 R64.2
$1N10786: CN3.1 R66.1
$1N13935: Q4.1(B) R60.1
$1N13938: Q4.3(C) R58.2
$1N13943: R58.1 U12.2(LEDK)
$1N16279: R59.2 U14.1(ANODE)
$1N16747: R31.1 R46.2 V3.1(R)
$1N16916: LED4.2(A) R35.1
$1N17016: LED4.1(C) R33.1 R34.1 U8.3(D)
$1N17036: Q3.1(B) R32.1 V3.2(K)
$1N17466: R19.1 R25.2 V2.1(R)
$1N17469: LED3.2(A) R23.1
$1N17478: LED3.1(C) R21.1 R22.1 U5.3(D)
$1N17488: Q2.1(B) R20.1 V2.2(K)
$1N17839: R1.1 R14.2 V1.1(R)
$1N17842: LED2.2(A) R5.1
$1N17851: LED2.1(C) R3.1 R4.1 U2.3(D)
$1N17861: Q1.1(B) R2.1 V1.2(K)
$1N18300: R9.1 U1.8(VBUS)
$1N18355: R15.2 U1.3(CFG3)
$1N18831: C3.2 R24.1
$1N19361: LED1.1(C) R12.2
$1N19390: LED5.1(C) R47.1
$1N22459: FPC1.4 U6.8(VDD2)
$1N22462: FPC1.3 U6.7(VIA)
$1N22465: FPC1.2 U6.6(VOB)
$1N22468: FPC1.1 U6.5(GND2)
$1N34225: R42.2 SB3.1
$1N37928: R26.1 U16.6(OUT)
$1N37952: C5.1 C6.1 C13.2 L1.1 R27.1 R28.2 U16.4(IN+)
$1N40918: Q1.3(C) R67.2 U2.1(G)
$1N40926: Q2.3(C) R68.2 U5.1(G)
$1N40934: Q3.3(C) R69.2 U8.1(G)
$1N40963: C9.2 R70.1 U7.1(OUTA)
$1N40964: D2.2(A) R70.2
$1N41094: DC1.4 SB4.1 SB5.1
$1N41187: D2.1(K) R28.1 R41.2 R43.2 U4.5(FB)
$1N41220: C28.2 C29.2 D5.1(K) L5.1 R56.2 SB6.2 U11.4(EN) U11.5(VIN)
$1N47018: R13.1 U1.9(CFG1)

Not connected (* = marked no-connect by the designer): AUDIO1 5 6 7; AUDIO2 5 6; AUDIO3 3 5 6; CN1 4 5; DC1 2; FPC1 5 6; FPC2 5 6; FPC3 2 13 14; FPC4 11 13 14; L2 2; R42 3; SW1 1 4 5; SW2 0; U1 10(PG); U7 5(INB+) 6(INB-) 7(OUTB); U10 9(GPIO4) 10(GPIO5) 28(SPICS1) 30(SPIHD) 31(SPIWP) 32(SPICS0) 33(SPICLK) 34(SPIQ) 35(SPID) 36(SPICLK_N) 37(SPICLK_P) 38(GPIO33) 39(GPIO34) 40(GPIO35) 41(GPIO36) 42(GPIO37) 48(MTMS); U11 6(NC); U15 5(INB+) 6(INB-) 7(OUTB); USB1 A8(SBU1) B8(SBU2)

## Notes on the sheet
- SB4和SB5的短接只能二选一
  ①短接SB4时，外部DC口电源必须调至电池电压。
  ②短接SB5时，外部DC口电源电压为7-20V，
  输入的电源将由内部板子dcdc值超级电容电压充电。
- 可以使用GS8632-SR
- 均衡电路
- 充电电路
- MOS驱动升压
